# Altium schematic sheet a0206-2006.15.SchDoc
size 558 x 431 mm
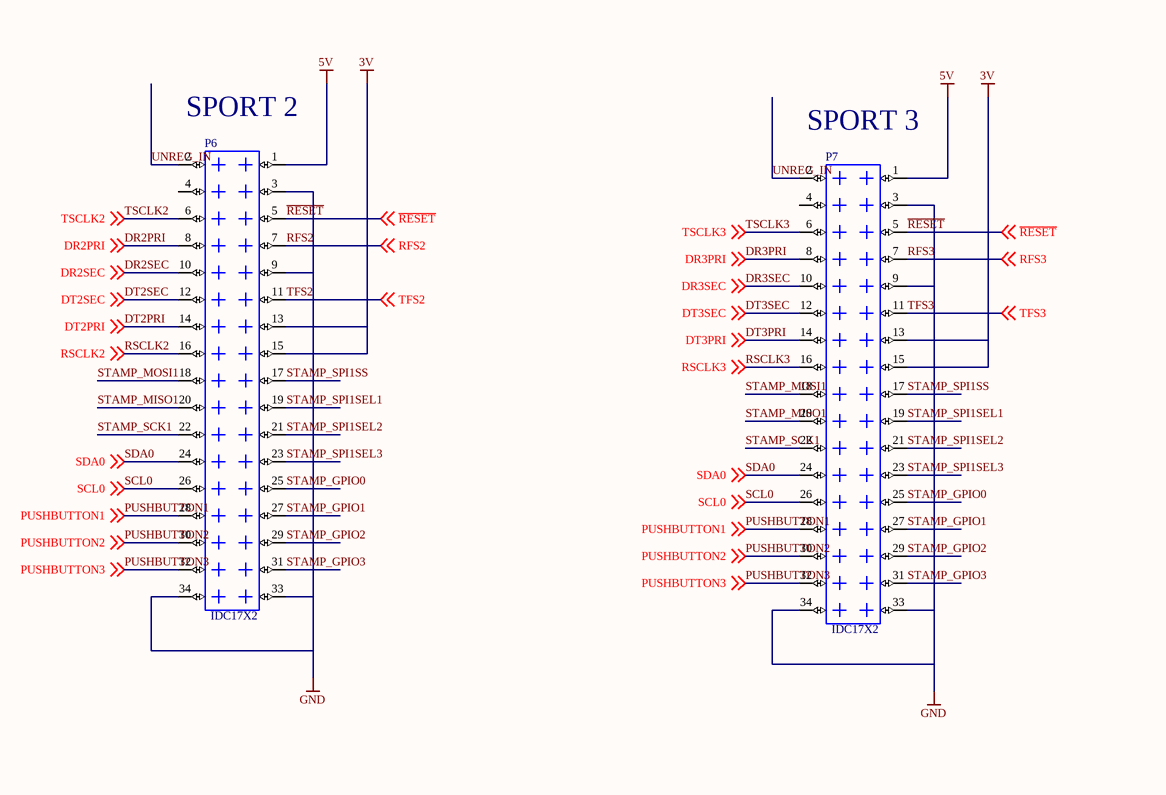
[diagram p0: a0206-2006.15.SchDoc, top left]
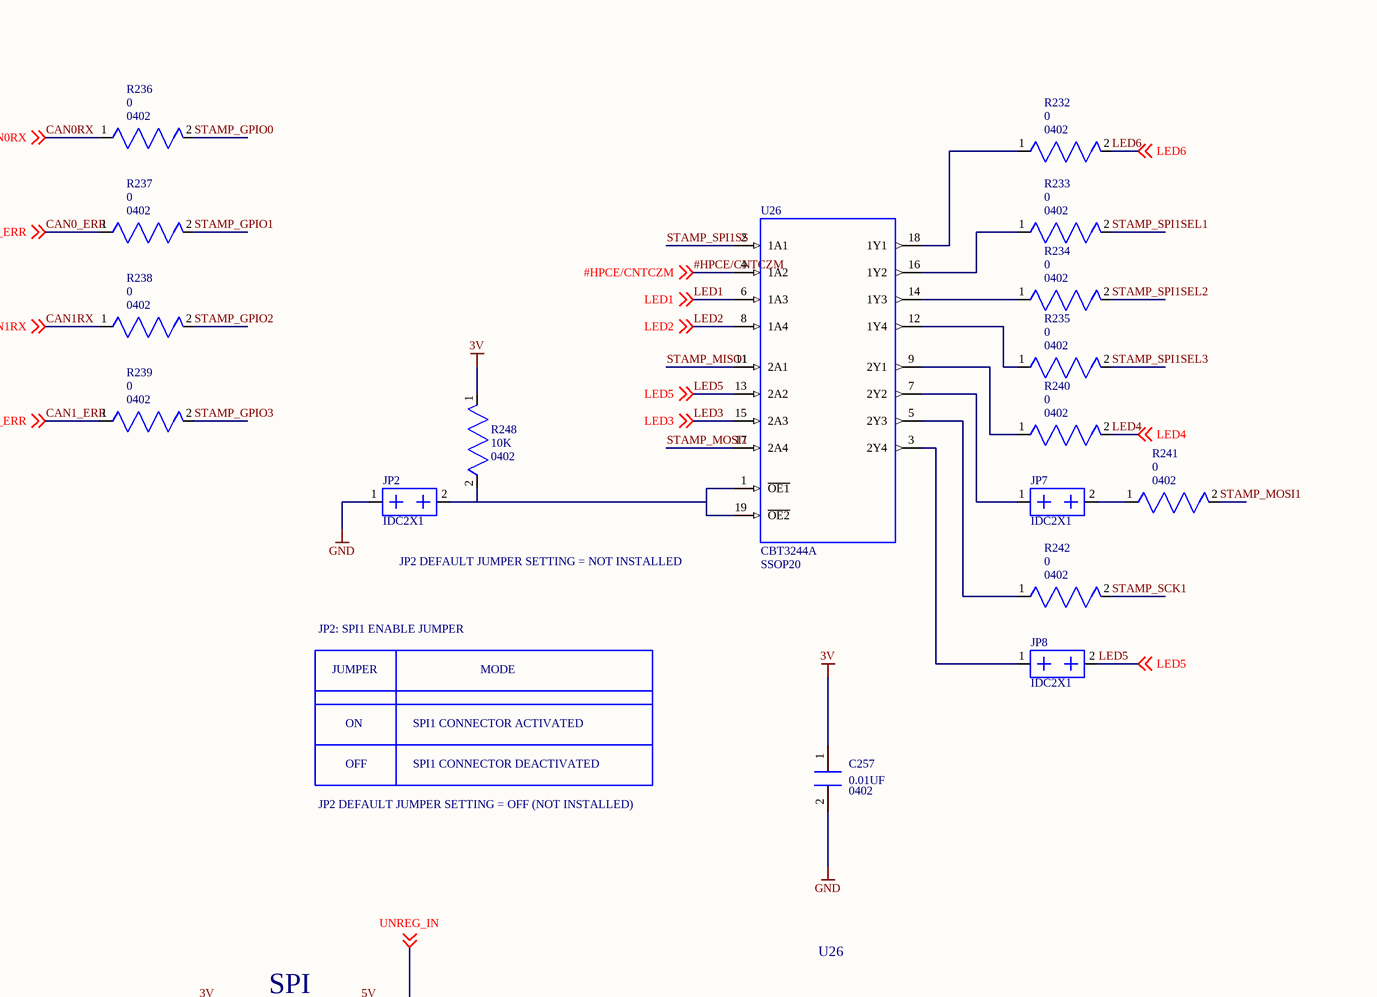
[diagram p1: a0206-2006.15.SchDoc, top right]
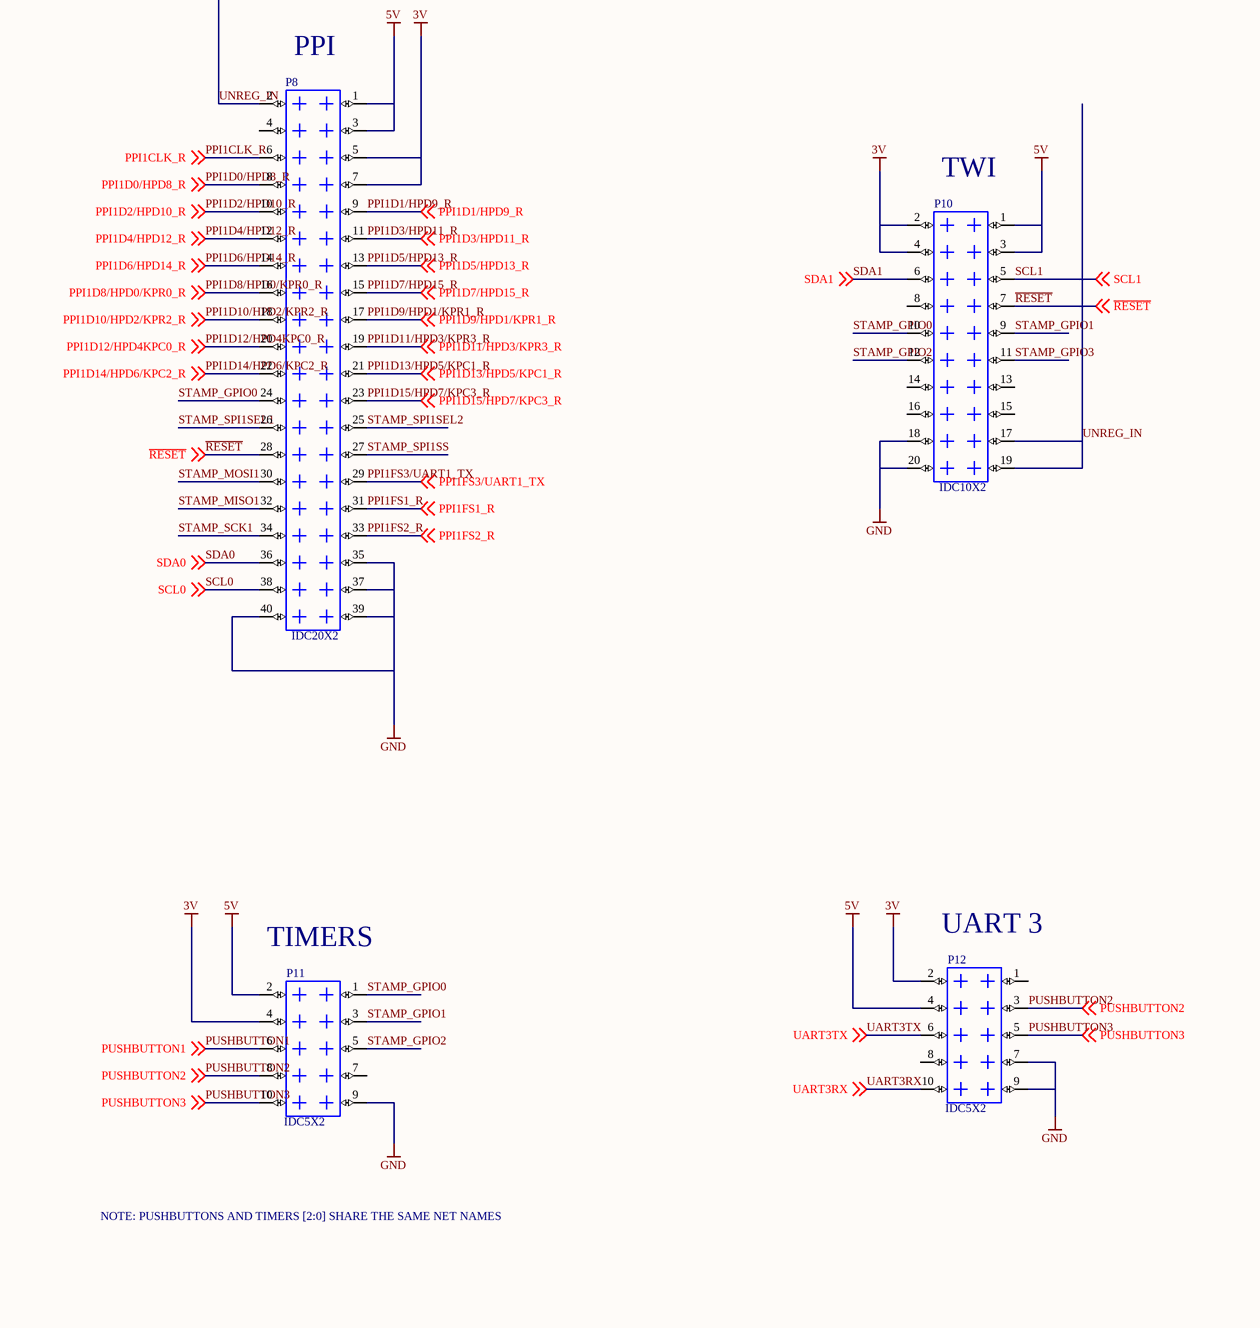
[diagram p2: a0206-2006.15.SchDoc, bottom left]
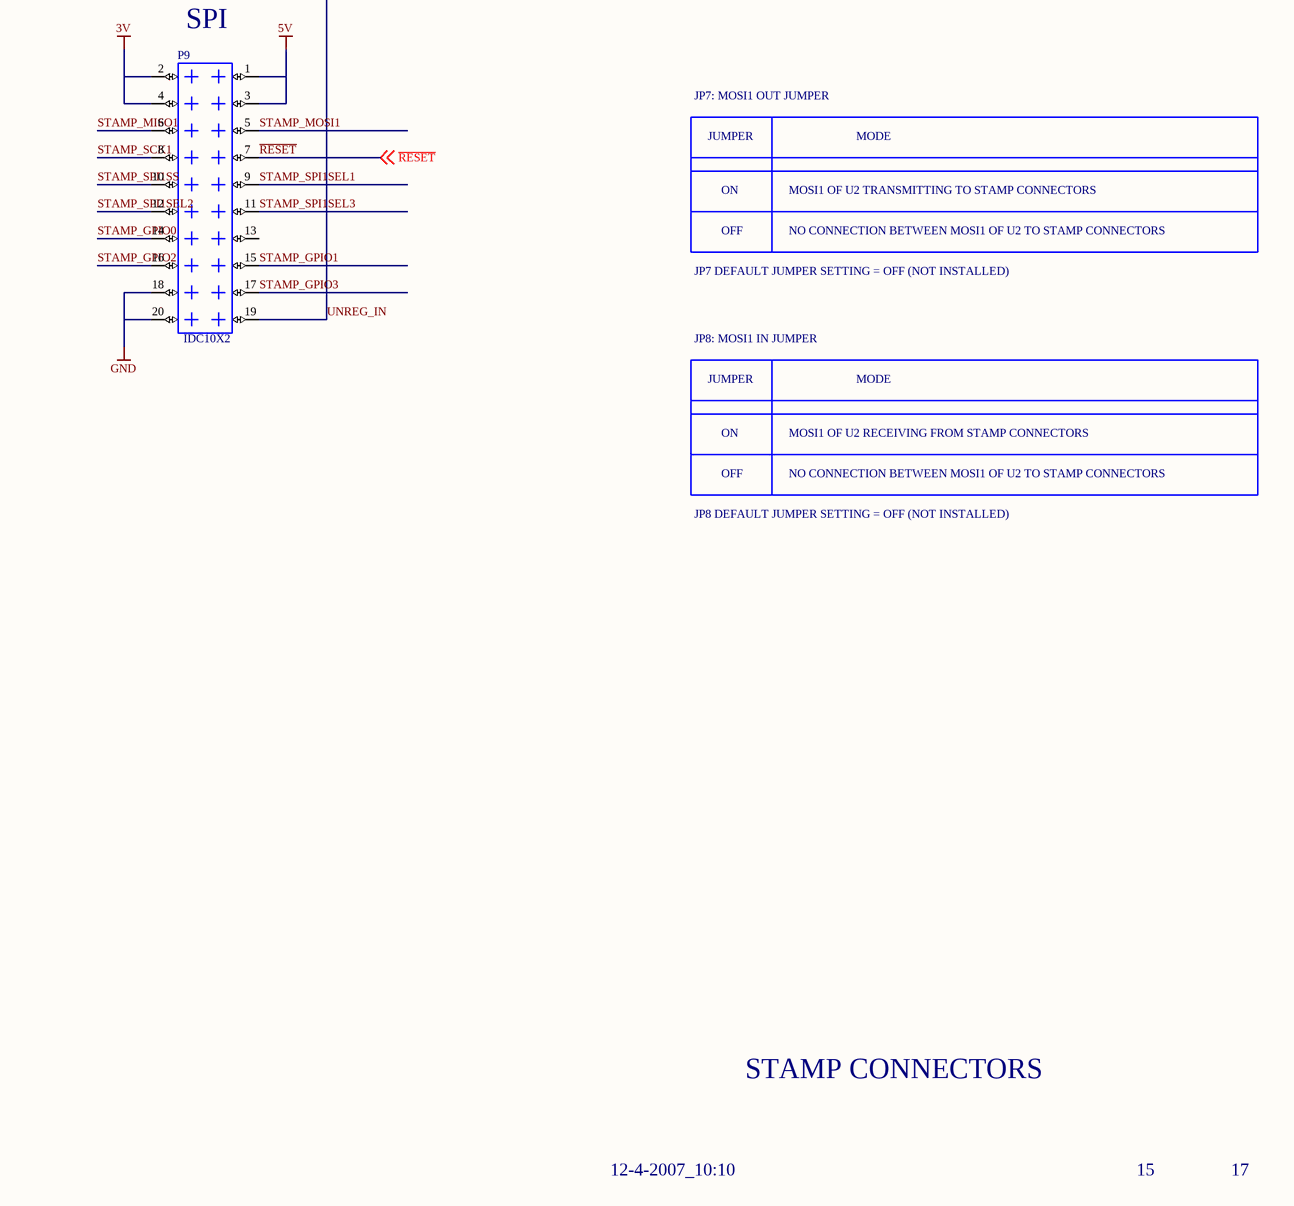
[diagram p3: a0206-2006.15.SchDoc, bottom right]

## Parts
C257  value 0.01UF  [0402]  (hidden comment: *)
JP2  *  [IDC2X1]  (value not drawn)
JP7  *  [IDC2X1]  (value not drawn)
JP8  *  [IDC2X1]  (value not drawn)
P6  *  [IDC17X2]  (value not drawn)
P7  *  [IDC17X2]  (value not drawn)
P8  *  [IDC20X2]  (value not drawn)
P9  *  [IDC10X2]  (value not drawn)
P10  *  [IDC10X2]  (value not drawn)
P11  *  [IDC5X2]  (value not drawn)
P12  *  [IDC5X2]  (value not drawn)
R232  value 0  [0402]  (hidden comment: *)
R233  value 0  [0402]  (hidden comment: *)
R234  value 0  [0402]  (hidden comment: *)
R235  value 0  [0402]  (hidden comment: *)
R236  value 0  [0402]  (hidden comment: *)
R237  value 0  [0402]  (hidden comment: *)
R238  value 0  [0402]  (hidden comment: *)
R239  value 0  [0402]  (hidden comment: *)
R240  value 0  [0402]  (hidden comment: *)
R241  value 0  [0402]  (hidden comment: *)
R242  value 0  [0402]  (hidden comment: *)
R248  value 10K  [0402]  (hidden comment: *)
U26  PART: CBT3244A  [SSOP20]  (hidden comment: *)

## Nets
3V: C257.1(A) P6.13 P6.15 P7.13 P7.15 P8.5 P8.7 P9.2 P9.4 P10.2 P10.4 P11.4 P12.2 R248.1(N1) U26.20(3V)
5V: P6.1 P7.1 P8.1 P8.3 P9.1 P9.3 P10.1 P10.3 P11.2 P12.4
GND: C257.2(B) JP2.1 P6.3 P6.9 P6.33 P6.34 P7.3 P7.9 P7.33 P7.34 P8.35 P8.37 P8.39 P8.40 P9.18 P9.20 P10.18 P10.20 P11.9 P12.7 P12.9 U26.10(GND)
#HPCE/CNTCZM: U26.4(1A2) ; off-sheet #HPCE/CNTCZM
CAN0_ERR: R237.1(N1) ; off-sheet CAN0_ERR
CAN0RX: R236.1(N1) ; off-sheet CAN0RX
CAN1_ERR: R239.1(N1) ; off-sheet CAN1_ERR
CAN1RX: R238.1(N1) ; off-sheet CAN1RX
DR2PRI: P6.8 ; off-sheet DR2PRI
DR2SEC: P6.10 ; off-sheet DR2SEC
DR3PRI: P7.8 ; off-sheet DR3PRI
DR3SEC: P7.10 ; off-sheet DR3SEC
DT2PRI: P6.14 ; off-sheet DT2PRI
DT2SEC: P6.12 ; off-sheet DT2SEC
DT3PRI: P7.14 ; off-sheet DT3PRI
DT3SEC: P7.12 ; off-sheet DT3SEC
LED1: U26.6(1A3) ; off-sheet LED1
LED2: U26.8(1A4) ; off-sheet LED2
LED3: U26.15(2A3) ; off-sheet LED3
LED4: R240.2(N2) ; off-sheet LED4
LED5: JP8.2 U26.13(2A2) ; off-sheet LED5
LED6: R232.2(N2) ; off-sheet LED6
PPI1CLK_R: P8.6 ; off-sheet PPI1CLK_R
PPI1D0/HPD8_R: P8.8 ; off-sheet PPI1D0/HPD8_R
PPI1D1/HPD9_R: P8.9 ; off-sheet PPI1D1/HPD9_R
PPI1D2/HPD10_R: P8.10 ; off-sheet PPI1D2/HPD10_R
PPI1D3/HPD11_R: P8.11 ; off-sheet PPI1D3/HPD11_R
PPI1D4/HPD12_R: P8.12 ; off-sheet PPI1D4/HPD12_R
PPI1D5/HPD13_R: P8.13 ; off-sheet PPI1D5/HPD13_R
PPI1D6/HPD14_R: P8.14 ; off-sheet PPI1D6/HPD14_R
PPI1D7/HPD15_R: P8.15 ; off-sheet PPI1D7/HPD15_R
PPI1D8/HPD0/KPR0_R: P8.16 ; off-sheet PPI1D8/HPD0/KPR0_R
PPI1D9/HPD1/KPR1_R: P8.17 ; off-sheet PPI1D9/HPD1/KPR1_R
PPI1D10/HPD2/KPR2_R: P8.18 ; off-sheet PPI1D10/HPD2/KPR2_R
PPI1D11/HPD3/KPR3_R: P8.19 ; off-sheet PPI1D11/HPD3/KPR3_R
PPI1D12/HPD4KPC0_R: P8.20 ; off-sheet PPI1D12/HPD4KPC0_R
PPI1D13/HPD5/KPC1_R: P8.21 ; off-sheet PPI1D13/HPD5/KPC1_R
PPI1D14/HPD6/KPC2_R: P8.22 ; off-sheet PPI1D14/HPD6/KPC2_R
PPI1D15/HPD7/KPC3_R: P8.23 ; off-sheet PPI1D15/HPD7/KPC3_R
PPI1FS1_R: P8.31 ; off-sheet PPI1FS1_R
PPI1FS2_R: P8.33 ; off-sheet PPI1FS2_R
PPI1FS3/UART1_TX: P8.29 ; off-sheet PPI1FS3/UART1_TX
PUSHBUTTON1: P6.28 P7.28 P11.6 ; off-sheet PUSHBUTTON1
PUSHBUTTON2: P6.30 P7.30 P11.8 P12.3 ; off-sheet PUSHBUTTON2
PUSHBUTTON3: P6.32 P7.32 P11.10 P12.5 ; off-sheet PUSHBUTTON3
~{RESET}: P6.5 P7.5 P8.28 P9.7 P10.7 ; off-sheet ~{RESET}
RFS2: P6.7 ; off-sheet RFS2
RFS3: P7.7 ; off-sheet RFS3
RSCLK2: P6.16 ; off-sheet RSCLK2
RSCLK3: P7.16 ; off-sheet RSCLK3
SCL0: P6.26 P7.26 P8.38 ; off-sheet SCL0
SCL1: P10.5 ; off-sheet SCL1
SDA0: P6.24 P7.24 P8.36 ; off-sheet SDA0
SDA1: P10.6 ; off-sheet SDA1
STAMP_GPIO0: P6.25 P7.25 P8.24 P9.14 P10.10 P11.1 R236.2(N2)
STAMP_GPIO1: P6.27 P7.27 P9.15 P10.9 P11.3 R237.2(N2)
STAMP_GPIO2: P6.29 P7.29 P9.16 P10.12 P11.5 R238.2(N2)
STAMP_GPIO3: P6.31 P7.31 P9.17 P10.11 R239.2(N2)
STAMP_MISO1: P6.20 P7.20 P8.32 P9.6 U26.11(2A1)
STAMP_MOSI1: P6.18 P7.18 P8.30 P9.5 R241.2(N2) U26.17(2A4)
STAMP_SCK1: P6.22 P7.22 P8.34 P9.8 R242.2(N2)
STAMP_SPI1SEL1: P6.19 P7.19 P8.26 P9.9 R233.2(N2)
STAMP_SPI1SEL2: P6.21 P7.21 P8.25 P9.12 R234.2(N2)
STAMP_SPI1SEL3: P6.23 P7.23 P9.11 R235.2(N2)
STAMP_SPI1SS: P6.17 P7.17 P8.27 P9.10 U26.2(1A1)
TFS2: P6.11 ; off-sheet TFS2
TFS3: P7.11 ; off-sheet TFS3
TSCLK2: P6.6 ; off-sheet TSCLK2
TSCLK3: P7.6 ; off-sheet TSCLK3
UART3RX: P12.10 ; off-sheet UART3RX
UART3TX: P12.6 ; off-sheet UART3TX
UNREG_IN: P6.2 P7.2 P8.2 P9.19 P10.17 P10.19 ; off-sheet UNREG_IN
NetJP2_2: JP2.2 R248.2(N2) U26.1(~{OE1}) U26.19(~{OE2})
NetJP7_1: JP7.1 U26.7(2Y2)
NetJP7_2: JP7.2 R241.1(N1)
NetJP8_1: JP8.1 U26.3(2Y4)
NetR232_1: R232.1(N1) U26.18(1Y1)
NetR233_1: R233.1(N1) U26.16(1Y2)
NetR234_1: R234.1(N1) U26.14(1Y3)
NetR235_1: R235.1(N1) U26.12(1Y4)
NetR240_1: R240.1(N1) U26.9(2Y1)
NetR242_1: R242.1(N1) U26.5(2Y3)

Not connected (* = marked no-connect by the designer): P6 4; P7 4; P8 4; P9 13; P10 8 13 14 15 16; P11 7; P12 1 8

## Notes on the sheet
- (near P6) SPORT 2
- (near P7) SPORT 3
- JP2 DEFAULT JUMPER SETTING = NOT INSTALLED
- JP2: SPI1 ENABLE JUMPER
- JUMPER
- MODE
- ON
- SPI1 CONNECTOR ACTIVATED
- JP2 DEFAULT JUMPER SETTING = OFF (NOT INSTALLED)
- OFF
- SPI1 CONNECTOR DEACTIVATED
- (near P8) PPI
- (near P10) TWI
- (near P9) SPI
- U26
- JP7: MOSI1 OUT JUMPER
- NO CONNECTION BETWEEN MOSI1 OF U2 TO STAMP CONNECTORS
- MOSI1 OF U2 TRANSMITTING TO STAMP CONNECTORS
- JP7 DEFAULT JUMPER SETTING = OFF (NOT INSTALLED)
- JP8: MOSI1 IN JUMPER
- MOSI1 OF U2 RECEIVING FROM STAMP CONNECTORS
- JP8 DEFAULT JUMPER SETTING = OFF (NOT INSTALLED)
- (near P11) TIMERS
- (near P12) UART 3
- NOTE: PUSHBUTTONS AND TIMERS [2:0] SHARE THE SAME NET NAMES
- STAMP CONNECTORS
- 12-4-2007_10:10
- 15
- 17
- A
- B
- C
- D
- 1
- 2
- 3
- 20 Cotton Road
- 4
- DEVICES
- ANALOG
- Nashua, NH 03063
- PH: 1-800-ANALOGD
- Title
- ADSP-BF548 EZ-KIT LITE
- Size
- Board No.
- A0206-2006
- Rev
- 1.4B
- Date
- Sheet
- of

## Library data of the parts
C257 = CAP_NON_POLARIZED.2: PART_SPEC: CAPACITOR; LEVEL: STD; TYPE: X7R; BOARDS: BOTH; PRT_NUM: 7000279; VOLTAGE: 16V; TOLERANCE: 10%; PKG_TYPE: 0402; ROHS: ROHS
JP2 JP8 = CON_2X1.2: HEADER; PART_SPEC: CONNECTOR; LEVEL: STD; PRT_NUM: 6000774; CONFIGURATION: 2X1; PKG_TYPE: IDC2X1; TYPE: IDC; ROHS: ROHS
JP7 = CON_2X1.2: HEADER; PART_SPEC: CONNECTOR; LEVEL: STD; CONFIGURATION: 2X1; PRT_NUM: 6000774; PKG_TYPE: IDC2X1; ROHS: ROHS; TYPE: IDC
P6 = CON_17X2.1: HEADER; PART_SPEC: CONNECTOR; LEVEL: STD; CONFIGURATION: 17X2; BOARDS: BOTH; PRT_NUM: 6000779; PKG_TYPE: IDC17X2; ROHS: ROHS; TYPE: IDC
P7 = CON_17X2.1: HEADER; PART_SPEC: CONNECTOR; LEVEL: STD; PRT_NUM: 6000779; BOARDS: BOTH; CONFIGURATION: 17X2; PKG_TYPE: IDC17X2; TYPE: IDC; ROHS: ROHS
P8 = CON_20X2.1: HEADER; PART_SPEC: CONNECTOR; LEVEL: STD; CONFIGURATION: 20X2; BOARDS: BOTH; PRT_NUM: 6000780; PKG_TYPE: IDC20X2; ROHS: ROHS; TYPE: IDC
P9 P10 = CON_10X2.1: HEADER; PART_SPEC: CONNECTOR; LEVEL: STD; CONFIGURATION: 10X2; BOARDS: BOTH; PRT_NUM: 6000778; PKG_TYPE: IDC10X2; ROHS: ROHS; TYPE: IDC
P11 P12 = CON_5X2.1: HEADER; PART_SPEC: CONNECTOR; LEVEL: STD; CONFIGURATION: 5X2; BOARDS: BOTH; PRT_NUM: 6000776; PKG_TYPE: IDC5X2; ROHS: ROHS; TYPE: IDC
R232 R234 R237 R239 R240 R242 = RES_STANDARD.1: PART_SPEC: RESISTOR; LEVEL: STD; PRT_NUM: 7000282; POWER: 1/16W; TOLERANCE: 5%; PKG_TYPE: 0402; ROHS: ROHS
R233 R235 R236 R238 R241 = RES_STANDARD.1: PART_SPEC: RESISTOR; LEVEL: STD; TOLERANCE: 5%; POWER: 1/16W; PRT_NUM: 7000282; PKG_TYPE: 0402; ROHS: ROHS
R248 = RES_STANDARD.2: PART_SPEC: RESISTOR; LEVEL: STD; PRT_NUM: 7000280; POWER: 1/16W; TOLERANCE: 5%; PKG_TYPE: 0402; ROHS: ROHS
U26 = ICS_SN74XXX244.1: OCTAL BUS SWITCH; LEVEL: STD; PRT_NUM: 1000450; PKG_TYPE: SSOP20; WEB: http://www.nxp.com/#/pip/cb; ROHS: ROHS